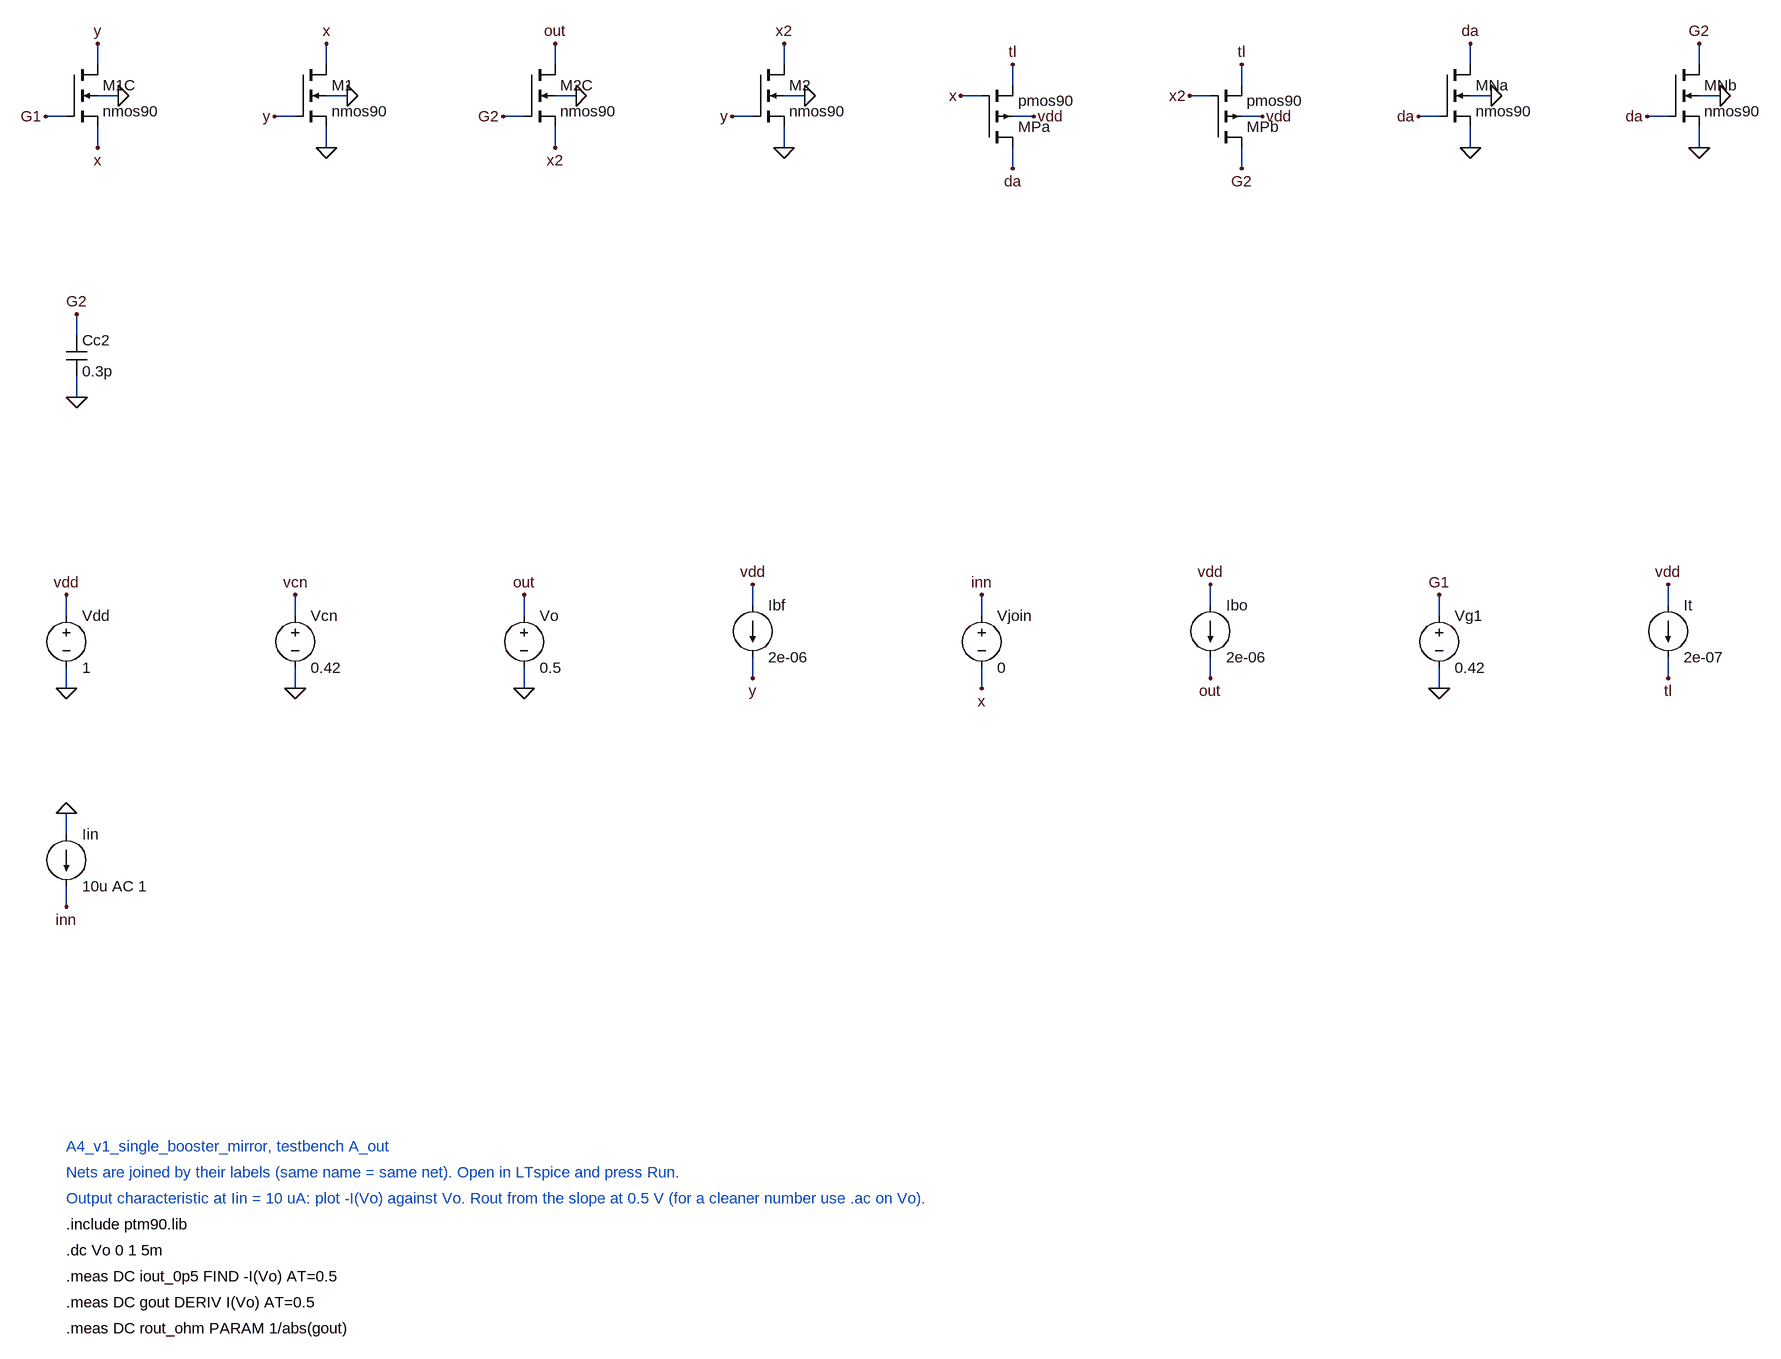
[diagram p0: schematic A4_v1_single_booster_mirror_A_out.asc]
A4_v1_single_booster_mirror_A_out.asc, the LTspice schematic file:
Version 4
SHEET 1 3200 2400
WIRE 48 0 48 -32
WIRE 0 80 -32 80
WIRE 48 96 48 128
WIRE 48 48 80 48
WIRE 400 0 400 -32
WIRE 352 80 320 80
WIRE 400 96 400 128
WIRE 400 48 432 48
WIRE 752 0 752 -32
WIRE 704 80 672 80
WIRE 752 96 752 128
WIRE 752 48 784 48
WIRE 1104 0 1104 -32
WIRE 1056 80 1024 80
WIRE 1104 96 1104 128
WIRE 1104 48 1136 48
WIRE 1456 128 1456 160
WIRE 1408 48 1376 48
WIRE 1456 32 1456 0
WIRE 1456 80 1488 80
WIRE 1808 128 1808 160
WIRE 1760 48 1728 48
WIRE 1808 32 1808 0
WIRE 1808 80 1840 80
WIRE 2160 0 2160 -32
WIRE 2112 80 2080 80
WIRE 2160 96 2160 128
WIRE 2160 48 2192 48
WIRE 2512 0 2512 -32
WIRE 2464 80 2432 80
WIRE 2512 96 2512 128
WIRE 2512 48 2544 48
WIRE 16 416 16 384
WIRE 16 480 16 512
WIRE 0 848 0 816
WIRE 0 928 0 960
WIRE 352 848 352 816
WIRE 352 928 352 960
WIRE 704 848 704 816
WIRE 704 928 704 960
WIRE 1056 832 1056 800
WIRE 1056 912 1056 944
WIRE 1408 848 1408 816
WIRE 1408 928 1408 960
WIRE 1760 832 1760 800
WIRE 1760 912 1760 944
WIRE 2112 848 2112 816
WIRE 2112 928 2112 960
WIRE 2464 832 2464 800
WIRE 2464 912 2464 944
WIRE 0 1184 0 1152
WIRE 0 1264 0 1296
FLAG 48 -32 y
FLAG -32 80 G1
FLAG 48 128 x
FLAG 80 48 0
FLAG 400 -32 x
FLAG 320 80 y
FLAG 400 128 0
FLAG 432 48 0
FLAG 752 -32 out
FLAG 672 80 G2
FLAG 752 128 x2
FLAG 784 48 0
FLAG 1104 -32 x2
FLAG 1024 80 y
FLAG 1104 128 0
FLAG 1136 48 0
FLAG 1456 160 da
FLAG 1376 48 x
FLAG 1456 0 tl
FLAG 1488 80 vdd
FLAG 1808 160 G2
FLAG 1728 48 x2
FLAG 1808 0 tl
FLAG 1840 80 vdd
FLAG 2160 -32 da
FLAG 2080 80 da
FLAG 2160 128 0
FLAG 2192 48 0
FLAG 2512 -32 G2
FLAG 2432 80 da
FLAG 2512 128 0
FLAG 2544 48 0
FLAG 16 384 G2
FLAG 16 512 0
FLAG 0 816 vdd
FLAG 0 960 0
FLAG 352 816 vcn
FLAG 352 960 0
FLAG 704 816 out
FLAG 704 960 0
FLAG 1056 800 vdd
FLAG 1056 944 y
FLAG 1408 816 inn
FLAG 1408 960 x
FLAG 1760 800 vdd
FLAG 1760 944 out
FLAG 2112 816 G1
FLAG 2112 960 0
FLAG 2464 800 vdd
FLAG 2464 944 tl
FLAG 0 1152 0
FLAG 0 1296 inn
SYMBOL nmos4 0 0 R0
SYMATTR InstName M1C
SYMATTR Value nmos90
SYMATTR Value2 W=40u L=360n
SYMBOL nmos4 352 0 R0
SYMATTR InstName M1
SYMATTR Value nmos90
SYMATTR Value2 W=10u L=360n
SYMBOL nmos4 704 0 R0
SYMATTR InstName M2C
SYMATTR Value nmos90
SYMATTR Value2 W=40u L=360n
SYMBOL nmos4 1056 0 R0
SYMATTR InstName M2
SYMATTR Value nmos90
SYMATTR Value2 W=10u L=360n
SYMBOL pmos4 1408 128 M180
SYMATTR InstName MPa
SYMATTR Value pmos90
SYMATTR Value2 W=0.25u L=1u
SYMBOL pmos4 1760 128 M180
SYMATTR InstName MPb
SYMATTR Value pmos90
SYMATTR Value2 W=0.25u L=1u
SYMBOL nmos4 2112 0 R0
SYMATTR InstName MNa
SYMATTR Value nmos90
SYMATTR Value2 W=1u L=360n
SYMBOL nmos4 2464 0 R0
SYMATTR InstName MNb
SYMATTR Value nmos90
SYMATTR Value2 W=1u L=360n
SYMBOL cap 0 416 R0
SYMATTR InstName Cc2
SYMATTR Value 0.3p
SYMBOL voltage 0 832 R0
SYMATTR InstName Vdd
SYMATTR Value 1
SYMBOL voltage 352 832 R0
SYMATTR InstName Vcn
SYMATTR Value 0.42
SYMBOL voltage 704 832 R0
SYMATTR InstName Vo
SYMATTR Value 0.5
SYMBOL current 1056 832 R0
SYMATTR InstName Ibf
SYMATTR Value 2e-06
SYMBOL voltage 1408 832 R0
SYMATTR InstName Vjoin
SYMATTR Value 0
SYMBOL current 1760 832 R0
SYMATTR InstName Ibo
SYMATTR Value 2e-06
SYMBOL voltage 2112 832 R0
SYMATTR InstName Vg1
SYMATTR Value 0.42
SYMBOL current 2464 832 R0
SYMATTR InstName It
SYMATTR Value 2e-07
SYMBOL current 0 1184 R0
SYMATTR InstName Iin
SYMATTR Value 10u AC 1
TEXT 0 1664 Left 2 ;A4_v1_single_booster_mirror, testbench A_out
TEXT 0 1704 Left 2 ;Nets are joined by their labels (same name = same net). Open in LTspice and press Run.
TEXT 0 1744 Left 2 ;Output characteristic at Iin = 10 uA: plot -I(Vo) against Vo. Rout from the slope at 0.5 V (for a cleaner number use .ac on Vo).
TEXT 0 1784 Left 2 !.include ptm90.lib
TEXT 0 1824 Left 2 !.dc Vo 0 1 5m
TEXT 0 1864 Left 2 !.meas DC iout_0p5 FIND -I(Vo) AT=0.5
TEXT 0 1904 Left 2 !.meas DC gout DERIV I(Vo) AT=0.5
TEXT 0 1944 Left 2 !.meas DC rout_ohm PARAM 1/abs(gout)

The netlist it stands for:
* A4_v1_single_booster_mirror_A_out.asc
M1C y G1 x 0 nmos90 W=40u L=360n
M1 x y 0 0 nmos90 W=10u L=360n
M2C out G2 x2 0 nmos90 W=40u L=360n
M2 x2 y 0 0 nmos90 W=10u L=360n
MPa da x tl vdd pmos90 W=0.25u L=1u
MPb G2 x2 tl vdd pmos90 W=0.25u L=1u
MNa da da 0 0 nmos90 W=1u L=360n
MNb G2 da 0 0 nmos90 W=1u L=360n
Cc2 G2 0 0.3p
Vdd vdd 0 1
Vcn vcn 0 0.42
Vo out 0 0.5
Ibf vdd y 2e-06
Vjoin inn x 0
Ibo vdd out 2e-06
Vg1 G1 0 0.42
It vdd tl 2e-07
Iin 0 inn 10u AC 1
.model NMOS NMOS
.model PMOS PMOS
.lib standard.mos
* A4_v1_single_booster_mirror, testbench A_out
* Nets are joined by their labels (same name = same net). Open in LTspice and press Run.
* Output characteristic at Iin = 10 uA: plot -I(Vo) against Vo. Rout from the slope at 0.5 V (for a cleaner number use .ac on Vo).
.include ptm90.lib
.dc Vo 0 1 5m
.meas DC iout_0p5 FIND -I(Vo) AT=0.5
.meas DC gout DERIV I(Vo) AT=0.5
.meas DC rout_ohm PARAM 1/abs(gout)
.backanno
.end